# EAGLE design EMountIface (EAGLE 9.7.0)
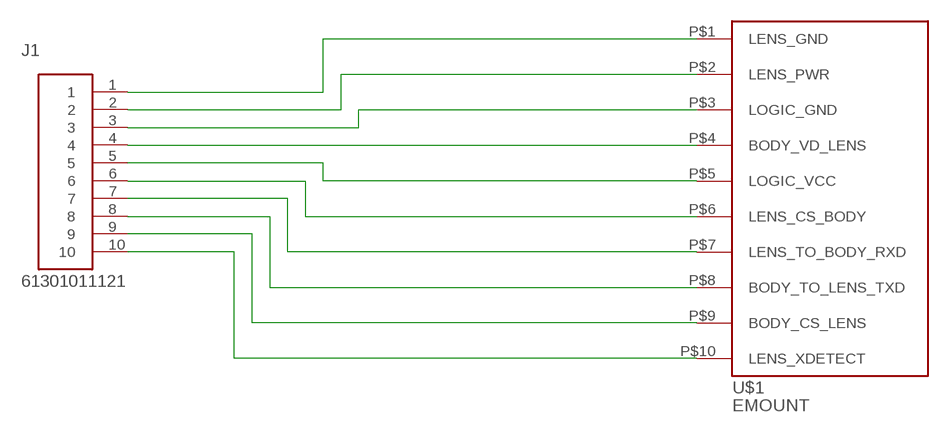
[diagram p0: schematic, sheet 1]

## Parts
J1  61301011121  [61301011121]
U$1  EMOUNT  [EMOUNT]

## Nets
N$1: J1.1 U$1.P$1(LENS_GND)
N$2: J1.2 U$1.P$2(LENS_PWR)
N$3: J1.3 U$1.P$3(LOGIC_GND)
N$4: J1.4 U$1.P$4(BODY_VD_LENS)
N$5: J1.5 U$1.P$5(LOGIC_VCC)
N$6: J1.6 U$1.P$6(LENS_CS_BODY)
N$7: J1.7 U$1.P$7(LENS_TO_BODY_RXD)
N$8: J1.8 U$1.P$8(BODY_TO_LENS_TXD)
N$9: J1.9 U$1.P$9(BODY_CS_LENS)
N$10: J1.10 U$1.P$10(LENS_XDETECT)

## Library data of the parts
J1 = Headers:61301011121: CONN HEADER VERT 10POS 2.54MM Manufacturer's datasheet <https://katalog.we-online.de/em/datasheet/6130xx11121.pdf>
U$1 = EMountPCB:EMOUNT

## Board
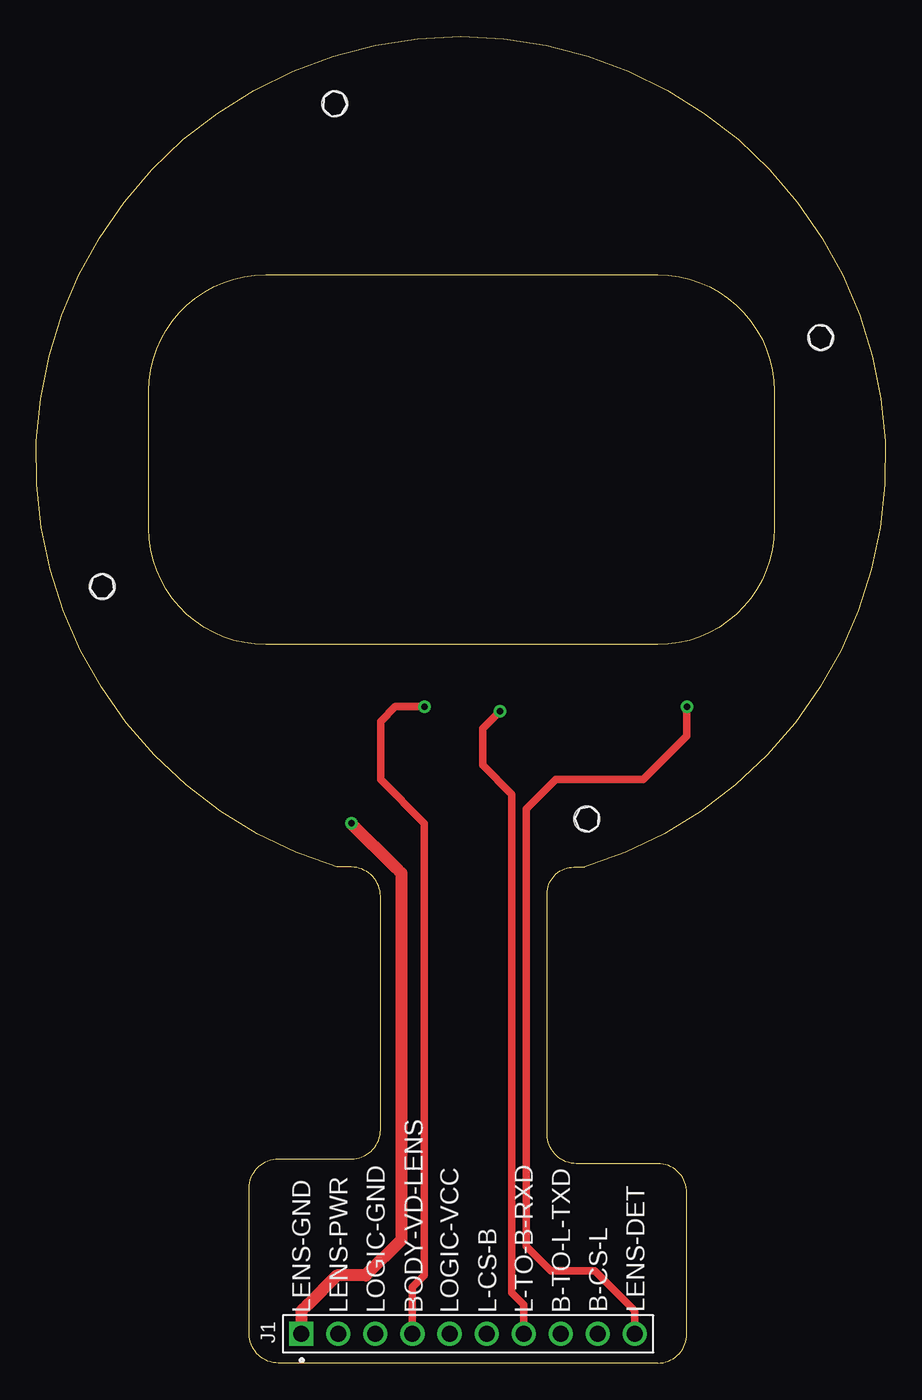
[diagram p1: board, top side]
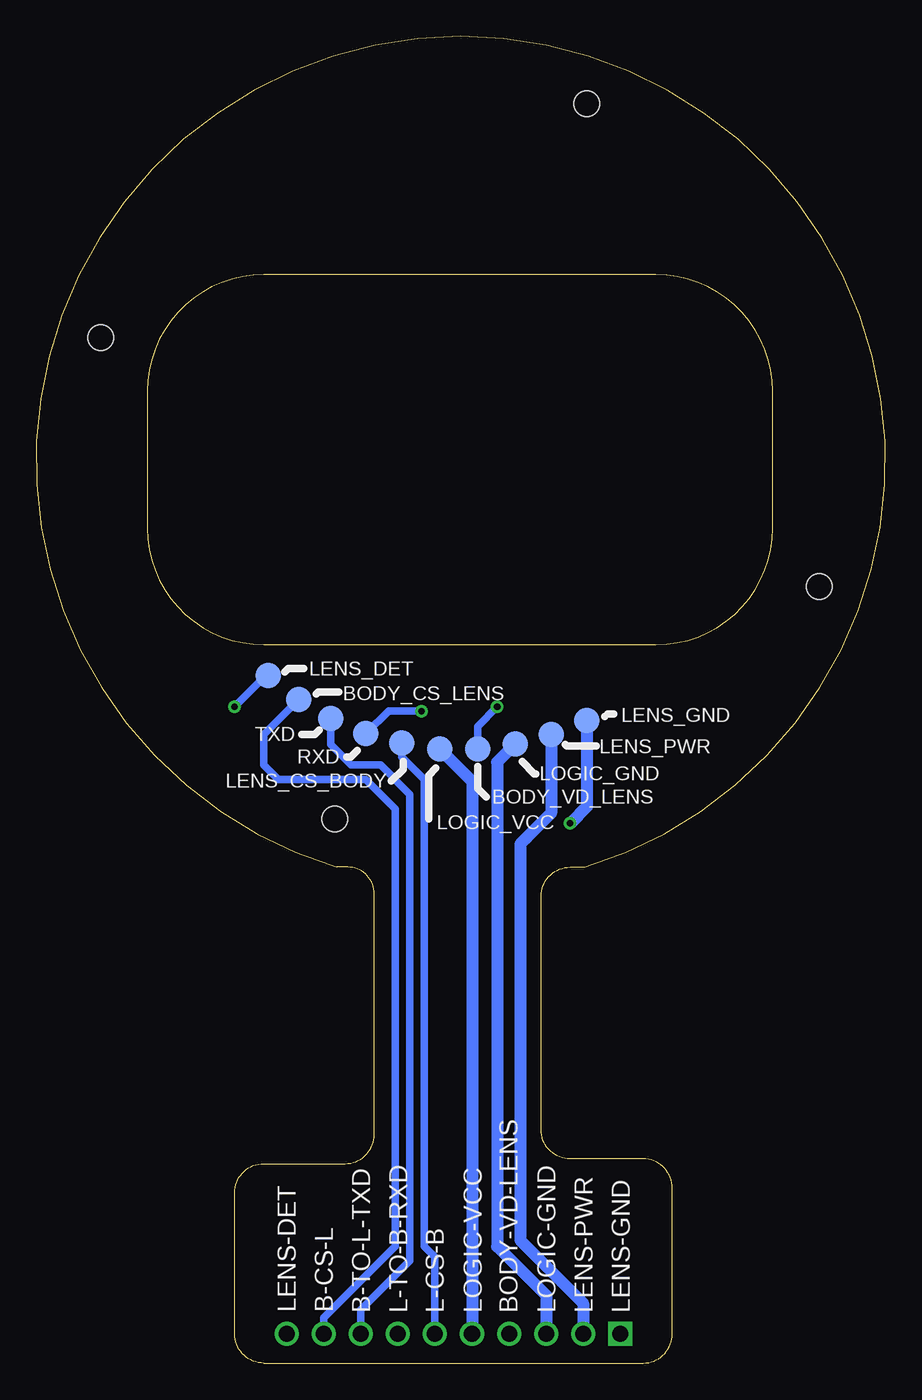
[diagram p2: board, bottom side, seen from below]

Size 58.16 x 90.96 mm. Coordinates in mm from the lower left corner, seen from the top.
Outline: 42.58,0 16.58,0 arc-90 14.58,2 14.58,4 14.58,12 arc-90 16.58,14 20.58,14 21.58,14 arc90 23.58,16 23.58,32 arc90 21.58,34 20.58,34 arc-326 37.58,34 36.84,34 arc90 35,32.17 35,15.67 arc90 37,13.67 39.06,13.67 42.58,13.67 arc-90 44.58,11.67 44.58,4 44.58,2 arc-90 42.58,0
Copper layers (1*16): Top / Bottom
Stack-up Default Layer Stack: Top SilkScreen Epoxy Ink / Top SolderMask SR:Yellow 0.0254mm Dk 4 / Top Surface Finish Lead-Free 0.02mm / Top CuFoil:003 0.012mm / Dielectric-1 Core:011 0.064mm / Bottom CuFoil:003 0.012mm / Bottom Surface Finish Lead-Free 0.02mm / Bottom SolderMask SR:Yellow 0.0254mm Dk 4 / Bottom SilkScreen Epoxy Ink
Design rules: minimum copper width 6mil, minimum drill size 0.35mm, copper clearance wire_polygon to wire_polygon 6mil, copper clearance wire_polygon to pad_smd 6mil, copper clearance wire_polygon to via 6mil, copper clearance pad_smd to pad_smd 6mil, copper clearance pad_smd to via 6mil, copper clearance via to via 6mil, copper clearance smd to pad (same net) 6mil, copper clearance smd to via (same net) 6mil, copper clearance smd to smd (same net) 6mil, dimension clearance 40mil, via restrict clearance 0mil, restrict clearance 0mil, drill distance 6mil, keepout clearance 0mil

### Footprints (pad centres in the part's own frame; a part is rotated, then mirrored left to right if it is on the bottom)
61301011121 = drill 1.1 square: 1 -11.43,0 | drill 1.1: 2 -8.89,0; 3 -6.35,0; 4 -3.81,0; 5 -1.27,0; 6 1.27,0; 7 3.81,0; 8 6.35,0; 9 8.89,0; 10 11.43,0
EMOUNT = smd 1.75 x 1.75 bottom: P$1 -9.15,-17.95; P$2 -6.7,-18.9; P$3 -4.25,-19.55; P$4 -1.65,-19.9; P$5 0.95,-19.9; P$6 3.55,-19.5; P$7 6,-18.85; P$8 8.4,-17.8; P$9 10.6,-16.5; P$10 12.7,-14.85 | hole 1.75: 24.175,8.3; -9.125,24.35; -25.08,-8.75; 8.15,-24.7

### Placement (x,y rotation side)
J1  29.58,2 0 top
U$1  29.58,62 0 top

### Tracks (layer width: path | path; a pad name or v marks a point on that pad's centre or on a via)
N$1  (via drill 0.45)
  Top 0.813: v21.58,37 24.58,34 25,33.58 25,10 25,8.42 22.58,6 20.58,6 18.58,4 18.15,3.57 J1.1
  Bottom 0.813: U$1.P$1 20.43,38.15 v21.58,37
N$2
  Bottom 0.813: U$1.P$2 22.88,37.7 24.58,36 25,35.58 25,10 25,8.42 21.58,5 20.69,4.11 J1.2
N$3
  Bottom 0.813: U$1.P$3 26.58,41.2 26.58,8 23.23,4.65 J1.3
N$4  (via drill 0.45)
  Top 0.508: v26.58,45 24.58,45 23.58,44 23.58,40 26.58,37 26.58,6 25.77,5.19 J1.4
  Bottom 0.508: U$1.P$4 27.93,43.65 v26.58,45
N$5
  Bottom 0.813: U$1.P$5 28.31,39.88 J1.5
N$6
  Bottom 0.508: U$1.P$6 33.13,41.55 31.58,40 31.58,8 30.85,7.27 J1.6
N$7  (via drill 0.45)
  Top 0.508: v31.78,44.7 30.58,43.5 30.58,41 32.58,39 32.58,8 32.58,4.8 33.18,4.2 33.39,3.99 J1.7
  Bottom 0.508: U$1.P$7 34.03,44.7 v31.78,44.7
N$8
  Bottom 0.508: U$1.P$8 37.98,42.4 36.58,41 34.58,41 32.58,39 32.58,7 35.93,3.65 J1.8
N$9
  Bottom 0.508: U$1.P$9 42.58,43.1 42.58,41 41.58,40 37.58,40 35.58,40 33.58,38 33.58,8 34.58,7 38.47,3.11 J1.9
N$10  (via drill 0.45)
  Top 0.508: v44.58,45 44.58,43 43.58,42 41.58,40 39.58,40 35.58,40 33.58,38 33.58,8 35.25,6.33 38.25,6.33 41.01,3.57 J1.10
  Bottom 0.508: U$1.P$10 42.43,47.15 v44.58,45

### Text on the board
SilkscreenTop: B-CS-L | LENS-DET | LENS-GND | LENS-PWR | LOGIC-GND | BODY-VD-LENS | LOGIC-VCC | L-CS-B | L-TO-B-RXD | B-TO-L-TXD
SilkscreenBottom: B-CS-L | LENS-DET | LENS-GND | LENS-PWR | LOGIC-GND | BODY-VD-LENS | LOGIC-VCC | L-CS-B | L-TO-B-RXD | B-TO-L-TXD